# EasyEDA Pro project 云台拓展板.eprj

# Schematic Schematic1
Assembly Variant: Basic; Board Name: Board1; Create Date: 2026-10-13; Page Name: P1; Project Name: yuntai; Schematic Name: Schematic1; Update Date: 2026-10-13; Company: 嘉立创EDA; Page Size: A4; Version: V1.0
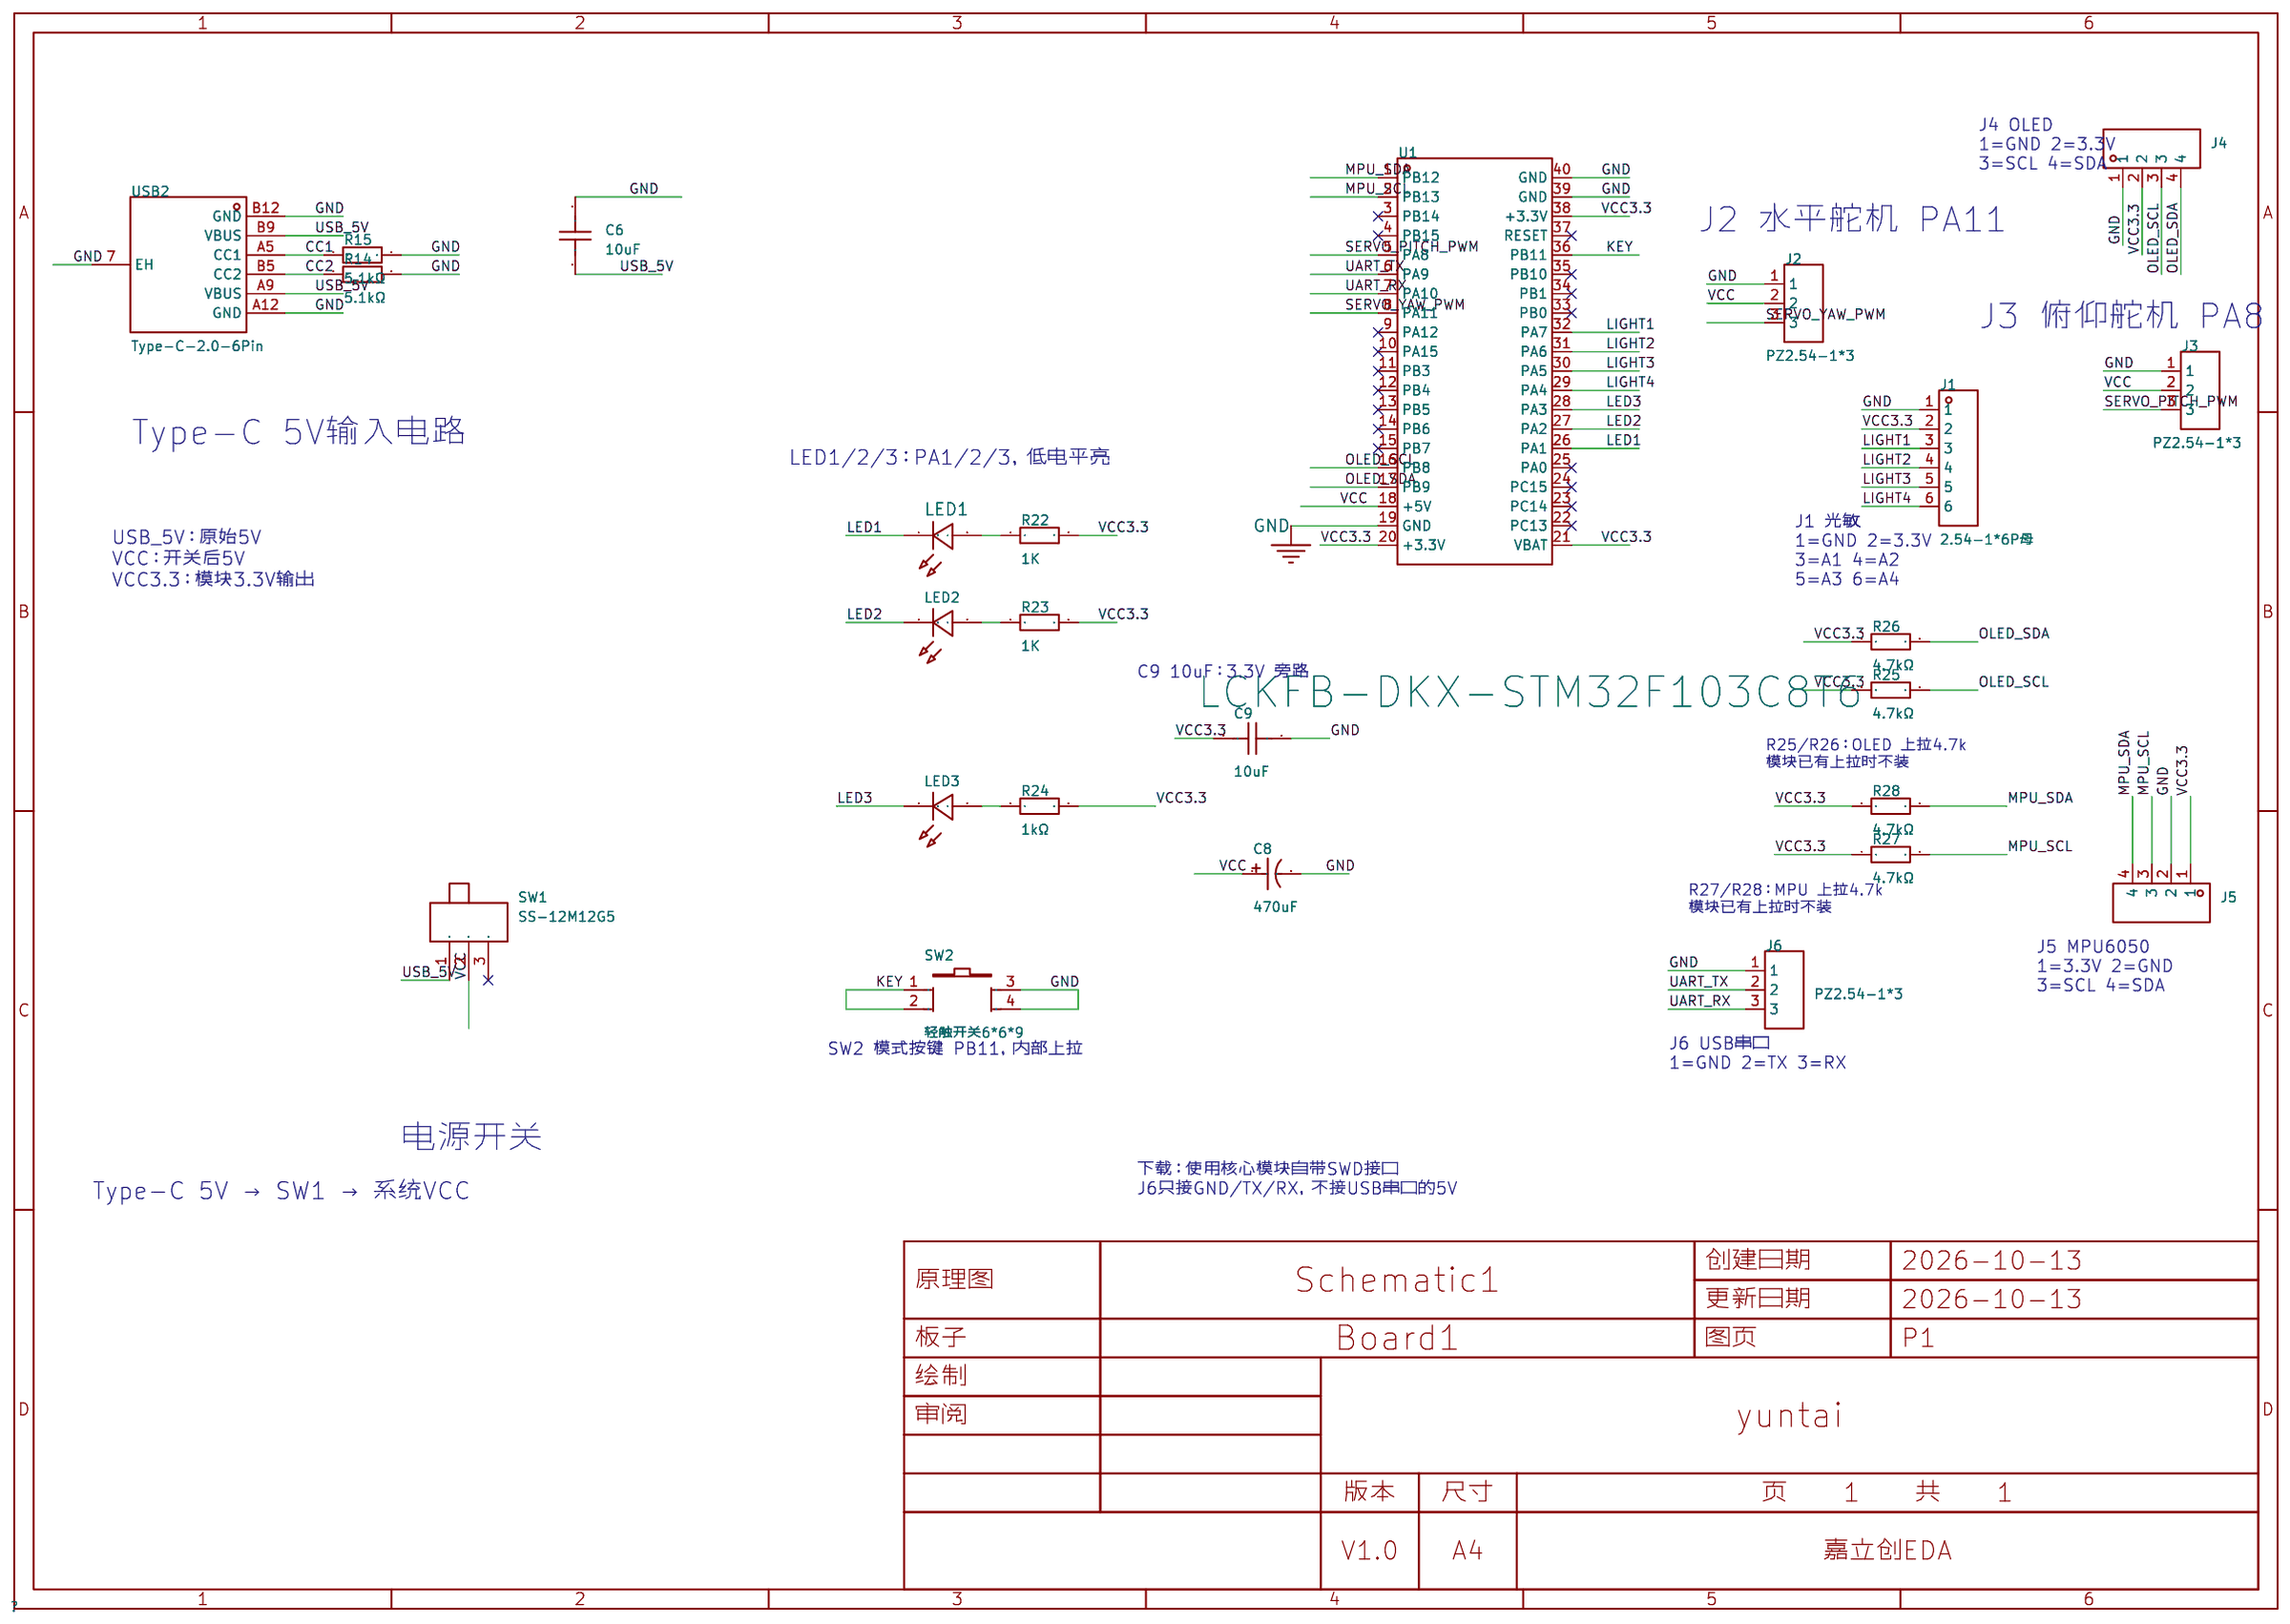
[diagram p0: schematic sheet]

## Parts
C6  10uF  [C0603]
C8  470uF  [CAP-TH_BD8.0-P3.50-D0.6-FD]
C9  10uF  [C0603]
J1  2.54-1*6P母  [HDR-TH_6P-P2.54-V-F]
J2  PZ2.54-1*3  [HDR-TH_3P-P2.54-V-M]
J3  PZ2.54-1*3  [HDR-TH_3P-P2.54-V-M]
J4  -  [HDR-TH_4P-P2.54-V-F]
J5  -  [HDR-TH_4P-P2.54-V-F]
J6  PZ2.54-1*3  [HDR-TH_3P-P2.54-V-M]
LED1  -  [LED_0805]
LED2  -  [LED_0805]
LED3  -  [LED_0805]
R14  5.1kΩ  [R0603]
R15  5.1kΩ  [R0603]
R22  1K  [R0603]
R23  1K  [R0603]
R24  1kΩ  [R0603]
R25  4.7kΩ  [R0805]
R26  4.7kΩ  [R0805]
R27  4.7kΩ  [R0805]
R28  4.7kΩ  [R0805]
SW1  SS-12M12G5  [SW-TH_SS-12M12G5]
SW2  轻触开关6*6*9  [KEY-TH_4P-L6.0-W6.0-P4.50]
U1  LCKFB-DKX-STM32F103C8T6  [CONN-TH_L53.3-W22.9_STM32F103C8T6-CARD]
USB2  Type-C-2.0-6Pin  [TYPE-C-SMD_TYPE-C-2.0-6PIN]

## Library data of the parts
C6 = CL10A106KP8NNNC: 容值:10uF;精度:±10%;额定电压:10V;材质(温度系数):X5R;; LCSC Part Name: 10uF ±10% 10V; Supplier Part: C19702; Manufacturer: SAMSUNG(三星); Supplier Footprint: 0603; JLCPCB Part Class: Basic Part; Datasheet: https://item.szlcsc.com/datasheet/CL10A106KP8NNNC/20411.html; Supplier: LCSC; Tolerance: ±10%; Voltage Rated: 10V; Temperature Coefficient: X5R; Voltage Rating: 10V
C8 = 10YXF470MEFCT78X11.5: 容值:470uF;精度:±20%;额定电压:10V;纹波电流:400mA@100kHz;等效串联电阻(ESR):-;; LCSC Part Name: 470uF ±20% 10V; Supplier Part: C88765; Manufacturer: Rubycon(红宝石); Supplier Footprint: 插件,D8xL11.5mm; JLCPCB Part Class: Extended Part; Datasheet: https://item.szlcsc.com/datasheet/10YXF470MEFCT78X11.5/89945.html; Supplier: LCSC; Tolerance: ±20%; Voltage Rating: 10V; Ripple Current: 400mA@100kHz; Pin Spacing: 3.5mm; Diameter: 8mm; Height - Seated (Max): 11.5mm; Lifetime: 6000hrs@105℃; Operating Temperature: -40℃~+105℃
C9 = CL10A106KP8NNNC: 容值:10uF;精度:±10%;额定电压:10V;温度系数:X5R;; LCSC Part Name: 10uF ±10% 10V; Supplier Part: C19702; Manufacturer: SAMSUNG(三星); Supplier Footprint: 0603; JLCPCB Part Class: Basic Part; Datasheet: https://item.szlcsc.com/datasheet/CL10A106KP8NNNC/20411.html; Supplier: LCSC; Tolerance: ±10%; Voltage Rating: 10V; Temperature Coefficient: X5R
J1 = 2.54-1*6P母: 插孔结构:1x6P;间距:2.54mm;行距:-;圆孔/方孔:方孔;安装方式:直插;排数:单排;总孔位数:6P;额定电流:3A;额定电压:-;插孔方向:顶部;塑高:8.5mm;触头材质:黄铜;触头镀层:金;工作温度:-40℃~+105℃;; LCSC Part Name: 1x6P 间距:2.54mm 直插; Supplier Part: C40877; Manufacturer: BOOMELE(博穆精密); Supplier Footprint: 插件,P=2.54mm; JLCPCB Part Class: Extended Part; Datasheet: https://item.szlcsc.com/datasheet/2.54-1*6P%25E6%25AF%258D/41861.html; Supplier: LCSC; Holes Structure: 1x6P; Pitch: 2.54mm; Circular Hole / Square Hole: 方孔; Mounting Type: 直插; Number of Rows: 单排; Number of Positions: 6P; Current Rating: 3A; Holes Direction: 顶部; Insulation Height: 8.5mm; Contact Material: 黄铜; Contact Plating: 金; Operating Temperature: -40℃~+105℃; PIN Length: 3.2mm
J2 J3 J6 = PZ2.54-1*3: 插针结构:1x3P;间距:2.54mm;圆针/方针:方针;安装方式:直插;排数:单排;总PIN位数:3P;额定电流:2.5A;配合针长度:6mm;塑高:2.54mm;端接针长度:3mm;触头材质:黄铜;触头镀层:金;工作温度:-40℃~+105℃;; LCSC Part Name: 1x3P 间距:2.54mm 方针 直插; Supplier Part: C5360899; Manufacturer: ZHOURI(洲日); Supplier Footprint: 插件,P=2.54mm; JLCPCB Part Class: Extended Part; Datasheet: https://item.szlcsc.com/datasheet/PZ2.54-1*3/6180458.html; Supplier: LCSC; Pin Structure: 1x3P; Pitch: 2.54mm; Circluar Pins/Square Pins: 方针; Mounting Type: 直插; Number of Rows: 单排; Number of Pins: 3P; Current Rating: 2.5A; Length of Mating Pin: 6mm; Insulation Height: 2.54mm; Length of End Connection Pin: 3mm; Contact Material: 黄铜; Contact Plating: 金; Operating Temperature: -40℃~+105℃
J4 J5 = HDR-F_2.54_1x4P: Supplier Part: C2718488; Supplier Footprint: 插件,P=2.54mm; Manufacturer: BOOMELE(博穆精密); Manufacturer Part: 2.54-1*4P母; Supplier: LCSC; LCSC Part Name: 1x4P 间距:2.54mm 直插; JLCPCB Part Class: Extended Part; Datasheet: https://item.szlcsc.com/datasheet/2.54-1*4P%25E6%25AF%258D/2834502.html; Holes Structure: 1x4P; Pitch: 2.54mm; Circular Hole / Square Hole: 方孔; Mounting Type: 直插; Number of Rows: 单排; Number of Positions: 4P; Current Rating: 3A; Holes Direction: 顶部; Insulation Height: 8.5mm; Contact Material: 青铜; Contact Plating: 金; Operating Temperature: -40℃~+105℃; PIN Length: 3.2mm
LED1 = LED_0805-R: Supplier Footprint: 0805
LED2 = LED_0805-B: Supplier Footprint: 0805
LED3 = LED_0805-G: Supplier Footprint: 0805
R14 R15 = RT0603BRD075K1L: 电阻类型:薄膜电阻;阻值:5.1kΩ;精度:±0.1%;功率:100mW;最大工作电压:75V;温度系数:±25ppm/℃;; LCSC Part Name: 薄膜电阻 5.1kΩ ±0.1% 100mW; Supplier Part: C122969; Manufacturer: YAGEO(国巨); Supplier Footprint: 0603; JLCPCB Part Class: Extended Part; Datasheet: https://atta.szlcsc.com/upload/public/pdf/source/20170728/C122969_1501225761505848820.pdf; Supplier: LCSC; Type: 薄膜电阻; Tolerance: ±0.1%; Power(Watts): 100mW; Overload Voltage (Max): 75V; Temperature Coefficient: ±25ppm/℃; Operating Temperature Range: -55℃~+155℃
R22 R23 = Res_0603: Supplier Footprint: 0603
R24 = 0603WAF1001T5E: 电阻类型:厚膜电阻;阻值:1kΩ;精度:±1%;功率:100mW;工作电压:75V;温度系数:±100ppm/℃;; LCSC Part Name: 1kΩ ±1% 100mW 厚膜电阻; Supplier Part: C21190; Manufacturer: UNI-ROYAL(厚声); Supplier Footprint: 0603; JLCPCB Part Class: Basic Part; Datasheet: https://item.szlcsc.com/datasheet/0603WAF1001T5E/21904.html; Supplier: LCSC; Type: 厚膜电阻; Tolerance: ±1%; Power(Watts): 100mW; Voltage-Supply(Max): 75V; Temperature Coefficient: ±100ppm/℃; Operating Temperature: -55℃~+155℃
R25-R28 = 0805W8F4701T5E: 电阻类型:厚膜电阻;阻值:4.7kΩ;精度:±1%;功率:125mW;最大工作电压:150V;温度系数:±100ppm/℃;; LCSC Part Name: 4.7kΩ ±1% 125mW 厚膜电阻; Supplier Part: C17673; Manufacturer: UNI-ROYAL(厚声); Supplier Footprint: 0805; JLCPCB Part Class: Basic Part; Datasheet: https://atta.szlcsc.com/upload/public/pdf/source/20200306/C422600_1E6D84923E4A46A82E41ADD87F860B5C.pdf; Supplier: LCSC; Type: 厚膜电阻; Tolerance: ±1%; Power(Watts): 125mW; Overload Voltage (Max): 150V; Temperature Coefficient: ±100ppm/℃; Operating Temperature Range: -55℃~+155℃
SW1 = SS-12M12G5: 电路结构:单刀双掷;安装方式:弯插;开关颜色:黑色;额定电流:6A;额定电压:120V;工作寿命:1万次;; LCSC Part Name: 柄长5mm 弯插双档 滑动开关; Supplier Part: C2884789; Manufacturer: XKB Connection(中国星坤); Supplier Footprint: 弯插,13.2x7.2mm; JLCPCB Part Class: Extended Part; Datasheet: https://item.szlcsc.com/datasheet/SS-12M12G5/3095281.html; Supplier: LCSC; Circuit: 单刀双掷; Actuator Style: 矩形柱状; Termination Style: PC引脚; Length: 13.2mm; Width: 7.2mm; Switch Height: 6.6mm; Mounting Type: 弯插; Actuator Color: 黑色; Current Rating: 6A; Voltage Rating: 120V; Life: 1万次; Operating Temperature: -40℃~+85℃
SW2 = 轻触开关6*6*9: Supplier Part: C70910; Supplier Footprint: SMD; JLCPCB Part Class: Extended Part; Supplier: LCSC
U1 = LCKFB-DKX-STM32F103C8T6: LCSC Part Name: 立创·地阔星-STM32F103C8T6开发板; Supplier Part: C22396880; Manufacturer: 立创开发板; JLCPCB Part Class: 扩展库; Datasheet: https://atta.szlcsc.com/upload/public/pdf/source/20240801/7EEF69F7480DF7C6DA98696664D658D4.pdf; Supplier: LCSC
USB2 = Type-C-2.0-6Pin: 连接器类型:Type-C;协议标准:USB 2.0;公母:-;安装方式:卧贴;触点数量:6P;端口数量:1;额定电流 - 电源:5A;工作温度:-40℃~+85℃;; LCSC Part Name: Type-C 卧贴; Supplier Part: C2987385; Manufacturer: CIKI(皓富); Supplier Footprint: SMD; JLCPCB Part Class: Extended Part; Datasheet: https://item.szlcsc.com/datasheet/Type-C-2.0-6Pin/3440240.html; Supplier: LCSC; Connector Type: Type-C; Protocol Standard: USB 2.0; Mounting Type: 卧贴; Number of Contacts: 6P; Number of Ports: 1; Current Rating-Power: 5A; Voltage Rating: 20V; Connect-Disconnect Life: 3千次; Length: 6.8mm; Operating Temperature: -40℃~+85℃; PCB Layer: Default

## Nets
GND: C6.2 C8.2 C9.2 J1.1 J2.1 J3.1 J4.1 J5.2 J6.1 R14.2 R15.2 SW2.3 SW2.4 U1.19(GND) U1.39(GND) U1.40(GND) USB2.7(EH) USB2.A12(GND) USB2.B12(GND)
VCC: C8.1 J2.2 J3.2 SW1.2 U1.18(+5V)
VCC3.3: C9.1 J1.2 J4.2 J5.1 R22.2 R23.2 R24.2 R25.1 R26.1 R27.1 R28.1 U1.20(+3.3V) U1.21(VBAT) U1.38(+3.3V)
CC1: R15.1 USB2.A5(CC1)
CC2: R14.1 USB2.B5(CC2)
KEY: SW2.1 SW2.2 U1.36(PB11)
LED1: LED1.1(C) U1.26(PA1)
LED2: LED2.1(C) U1.27(PA2)
LED3: LED3.1(C) U1.28(PA3)
LIGHT1: J1.3 U1.32(PA7)
LIGHT2: J1.4 U1.31(PA6)
LIGHT3: J1.5 U1.30(PA5)
LIGHT4: J1.6 U1.29(PA4)
MPU_SCL: J5.3 R27.2 U1.2(PB13)
MPU_SDA: J5.4 R28.2 U1.1(PB12)
OLED_SCL: J4.3 R25.2 U1.16(PB8)
OLED_SDA: J4.4 R26.2 U1.17(PB9)
SERVO_PITCH_PWM: J3.3 U1.5(PA8)
SERVO_YAW_PWM: J2.3 U1.8(PA11)
UART_RX: J6.3 U1.7(PA10)
UART_TX: J6.2 U1.6(PA9)
USB_5V: C6.1 SW1.1 USB2.A9(VBUS) USB2.B9(VBUS)
$1N125: LED3.2(A) R24.1
$1N178: LED2.2(A) R23.1
$1N180: LED1.2(A) R22.1

Not connected (* = marked no-connect by the designer): SW1 3*; U1 3(PB14)* 4(PB15)* 9(PA12)* 10(PA15)* 11(PB3)* 12(PB4)* 13(PB5)* 14(PB6)* 15(PB7)* 22(PC13)* 23(PC14)* 24(PC15)* 25(PA0)* 33(PB0)* 34(PB1)* 35(PB10)* 37(RESET)*

## Notes on the sheet
- J4 OLED
  1=GND 2=3.3V
  3=SCL 4=SDA
- J2 水平舵机 PA11
- J3 俯仰舵机 PA8
- Type-C 5V输入电路
- LED1/2/3：PA1/2/3，低电平亮
- J1 光敏
  1=GND 2=3.3V
  3=A1 4=A2
  5=A3 6=A4
- USB_5V：原始5V
  VCC：开关后5V
  VCC3.3：模块3.3V输出
- C9 10uF：3.3V 旁路
- R25/R26：OLED 上拉4.7k
  模块已有上拉时不装
- R27/R28：MPU 上拉4.7k
  模块已有上拉时不装
- J5 MPU6050
  1=3.3V 2=GND
  3=SCL 4=SDA
- J6 USB串口
  1=GND 2=TX 3=RX
- SW2 模式按键 PB11，内部上拉
- 电源开关
- 下载：使用核心模块自带SWD接口
  J6只接GND/TX/RX，不接USB串口的5V
- Type-C 5V → SW1 → 系统VCC

# Board PCB1
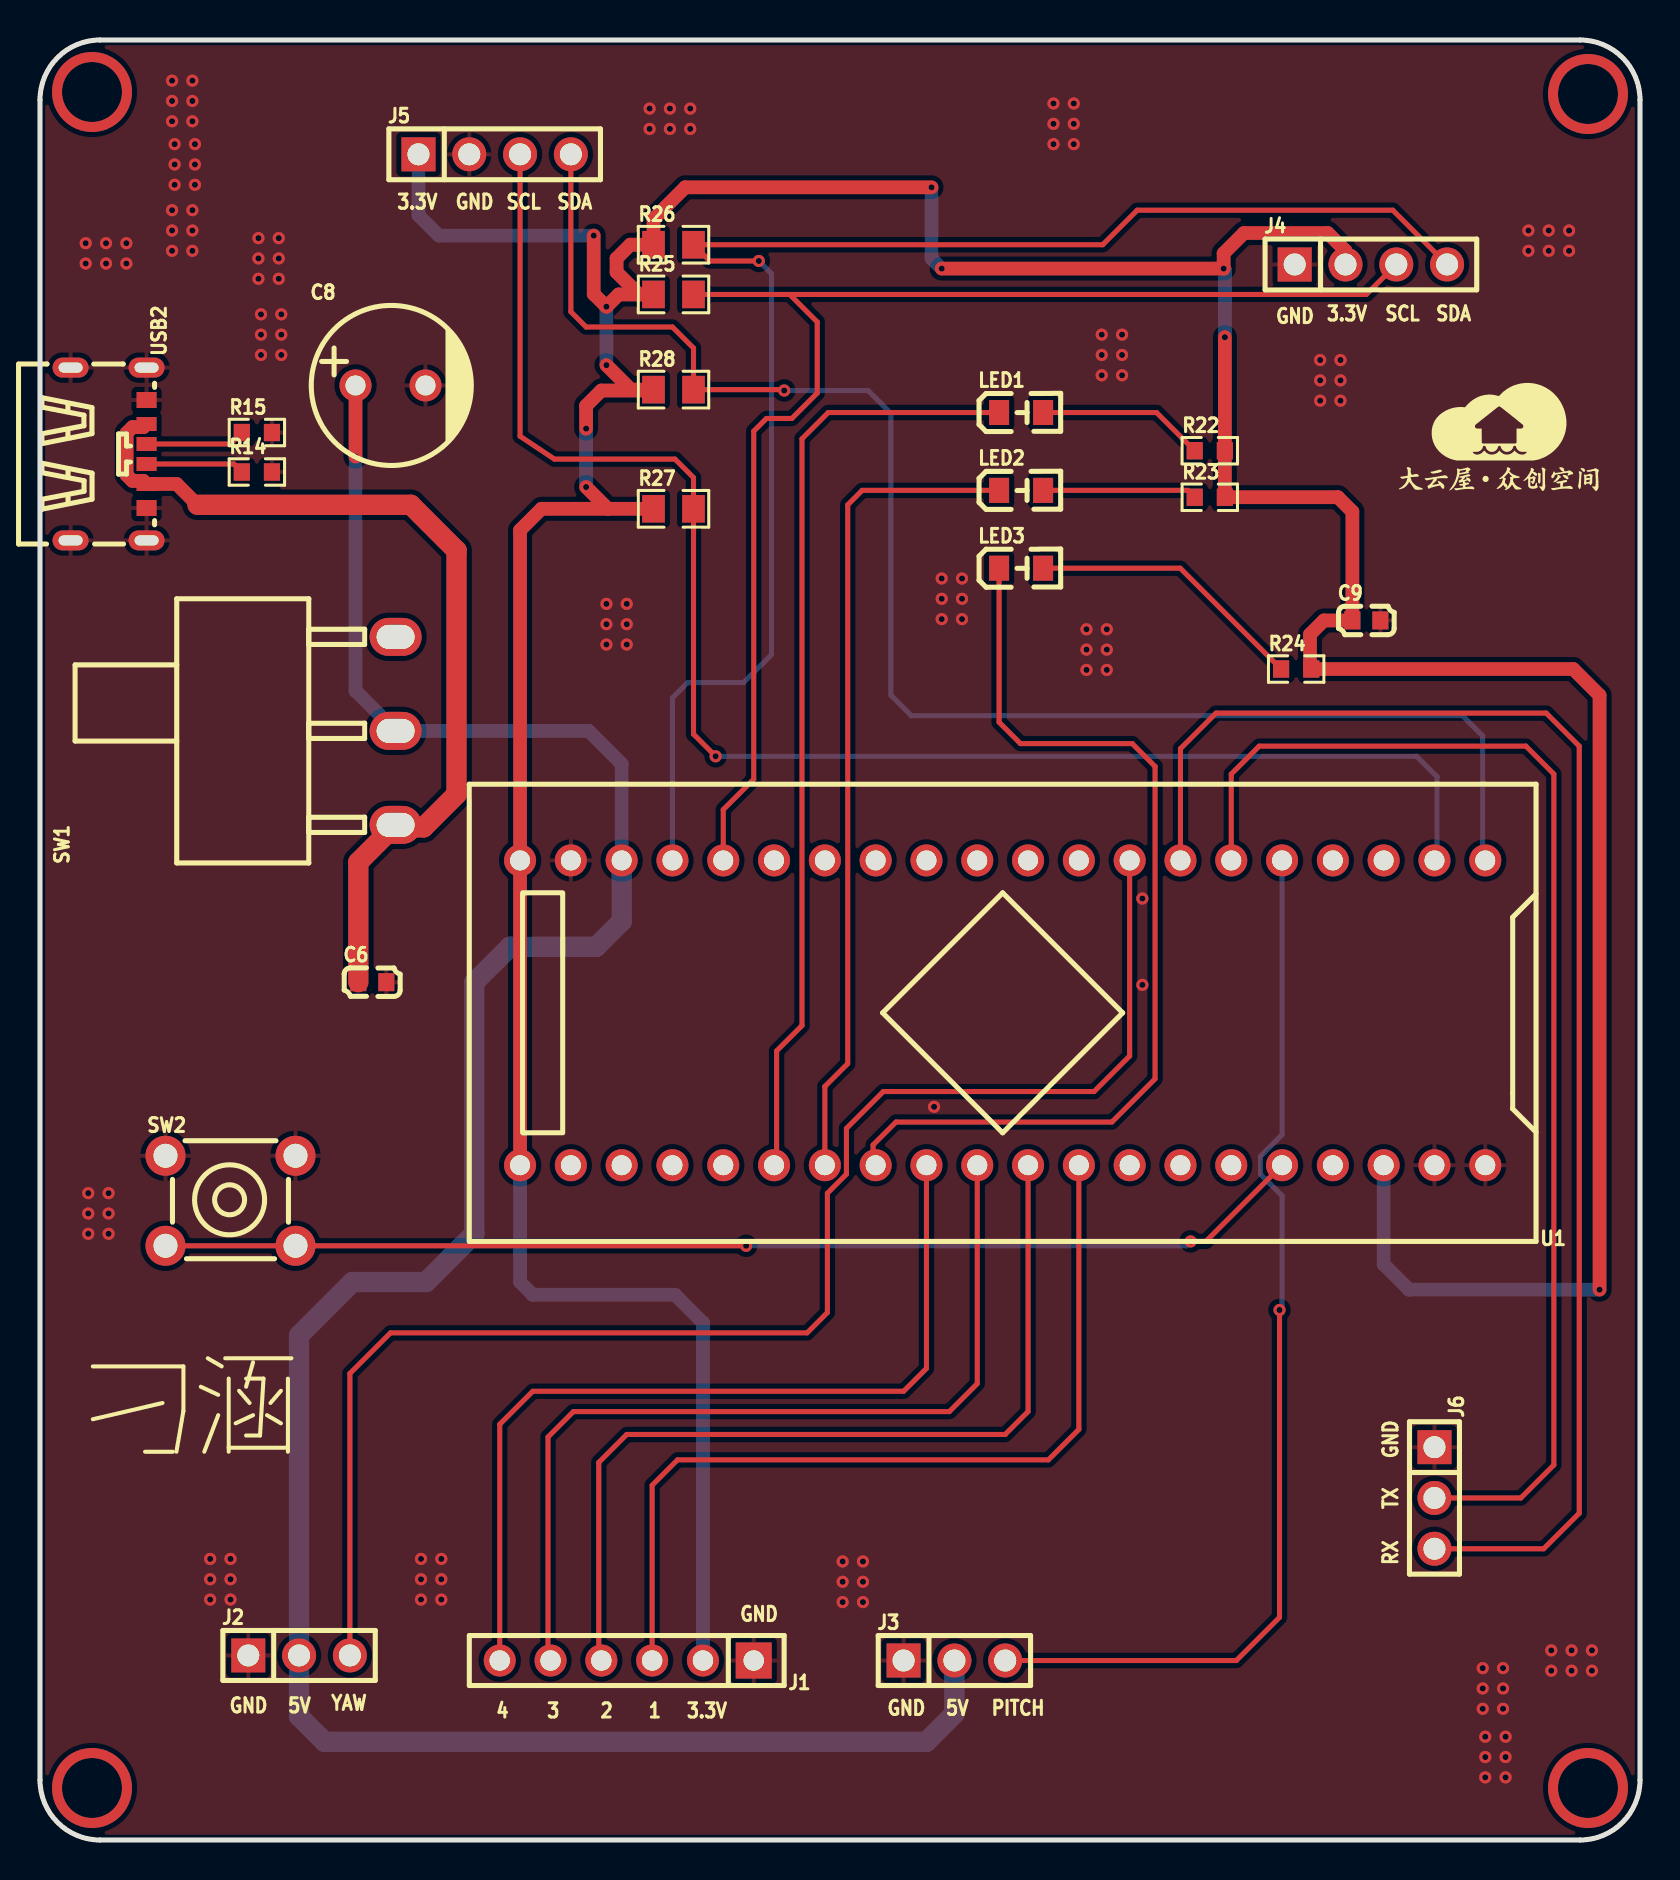
[diagram p1: board, top side]
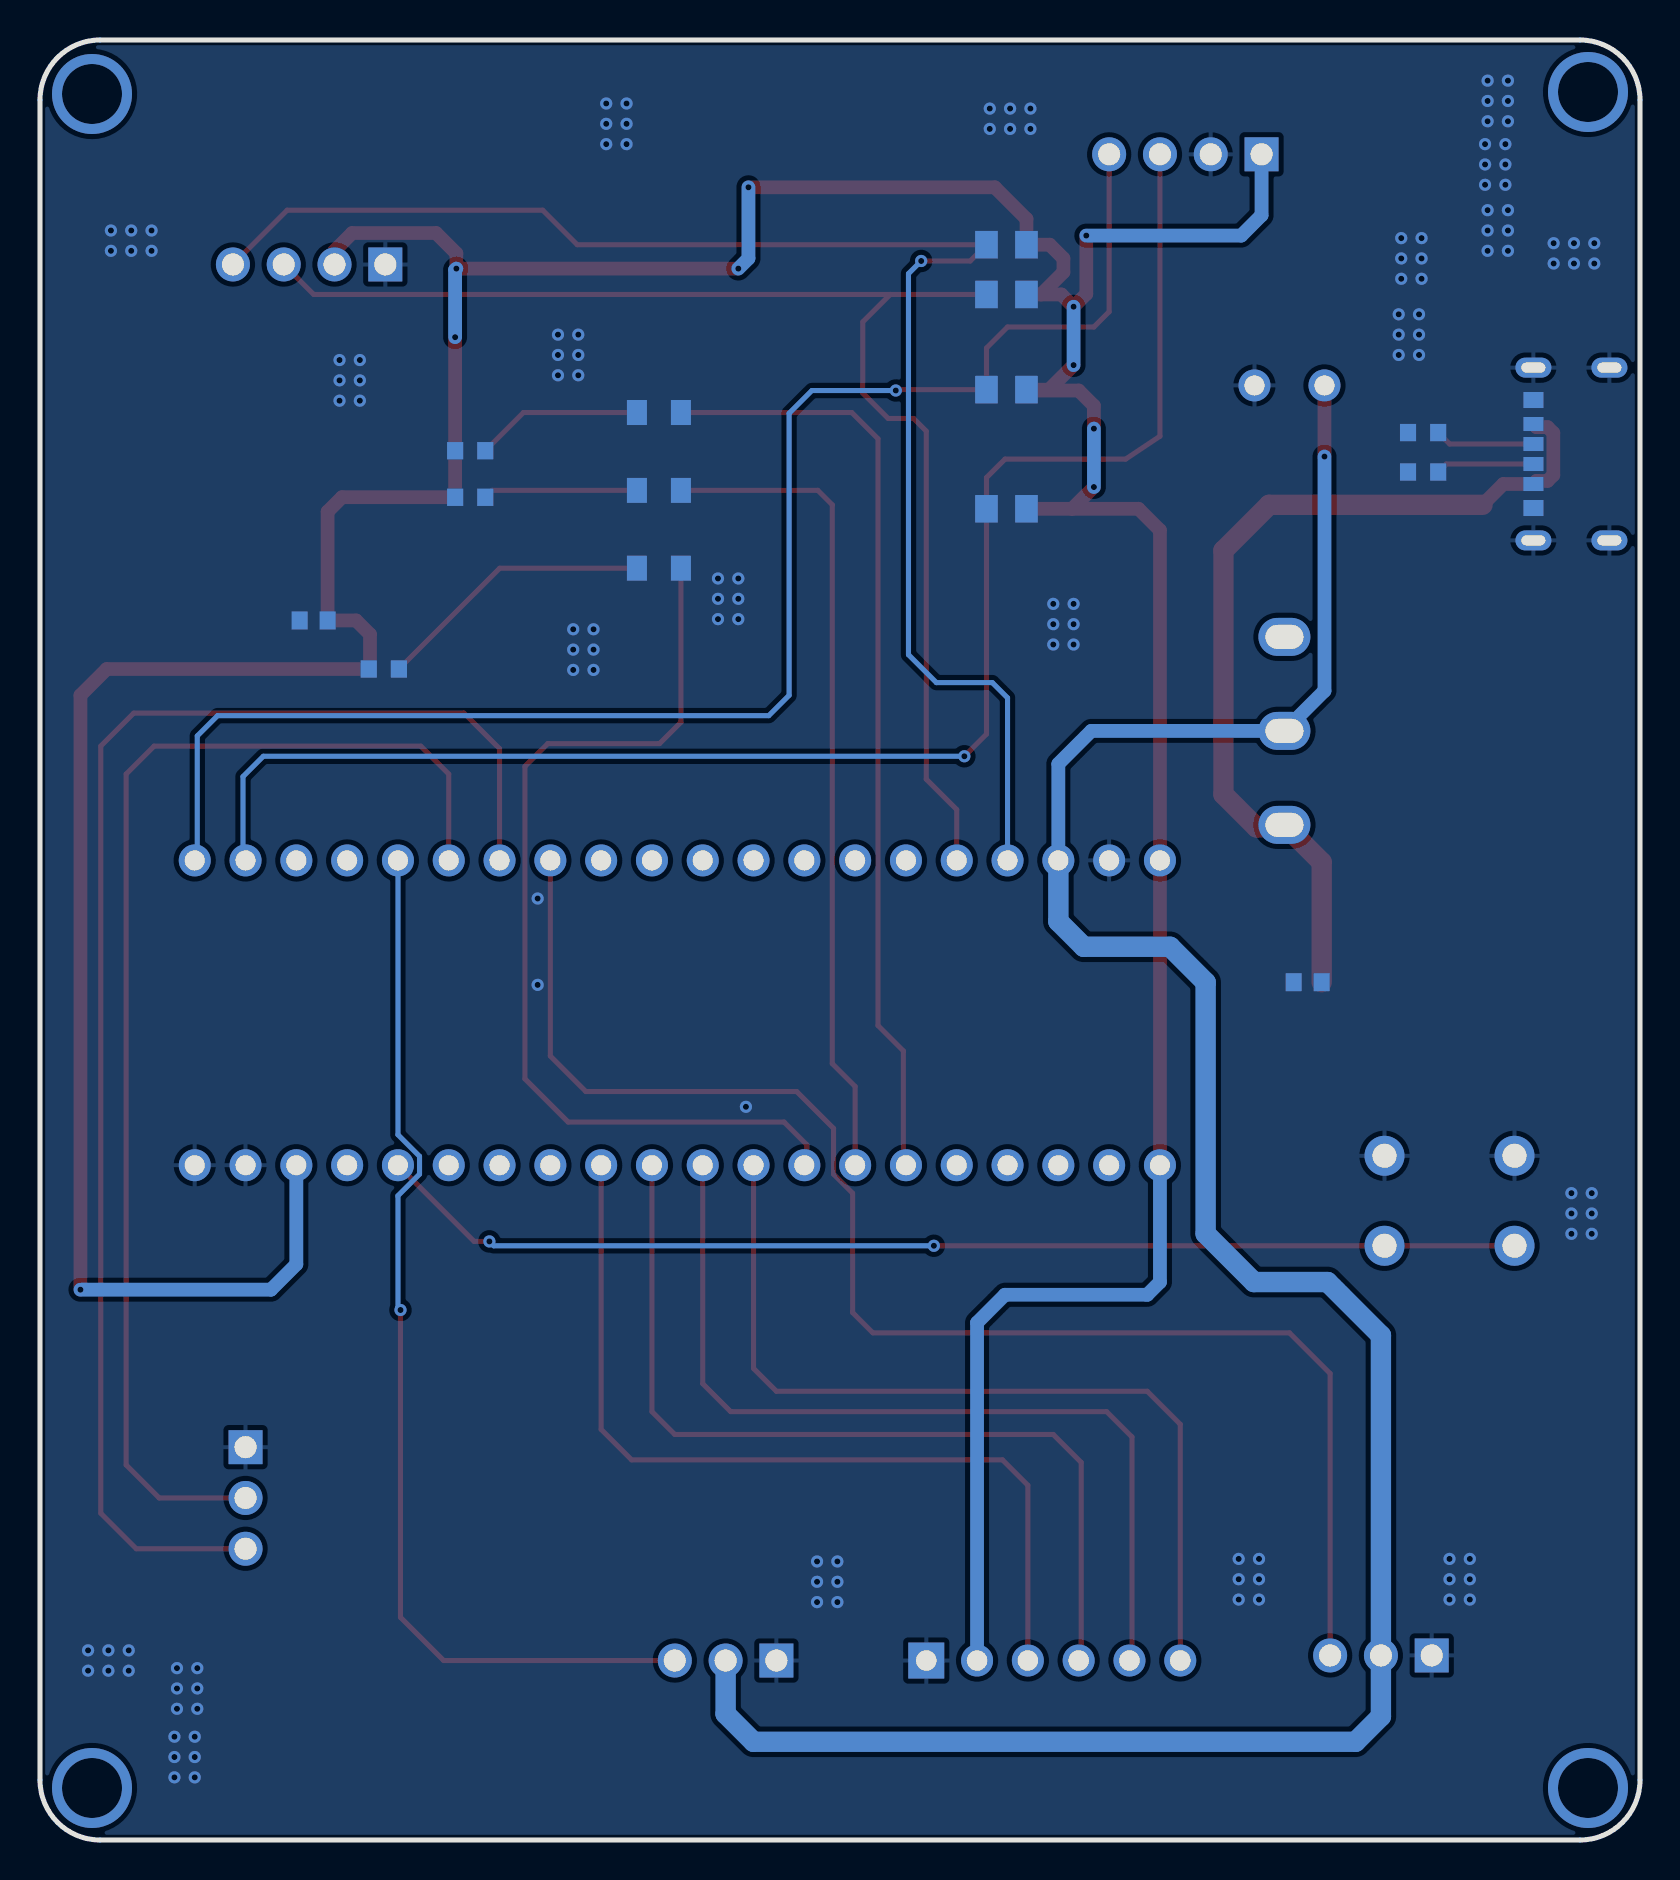
[diagram p2: board, bottom side, seen from below]

Outline 80 x 90 mm; copper layers: Top Layer, Bottom Layer. Coordinates in mm from the lower left corner of the outline.
Outline path: 0,87 0,3 arc(0.88,0.88) 3,0 77,0 arc(79.12,0.88) 80,3 80,87 arc(79.12,89.12) 77,90 3,90 arc(0.88,89.12) 0,87
Stack: Top Layer 0.035mm / Dielectric1 1.51mm FR4 er 4.5 / Bottom Layer 0.035mm

## Design rules (mm)
spacing copperThickness1oz (default): track to track 0.102, other pairs 0.152 to 0.3
spacing copperThickness2oz: track to track 0.203, other pairs 0.152 to 0.3
track width copperThickness1oz (default): min 0.127, default 0.254, max 2.54
track width copperThickness2oz: min 0.203, default 0.254, max 2.54
differential pair differentialPair (default): width min 0.127, default 0.254, max 2.54; gap min 0.152, default 0.152
net GND uses copperRegion

## Placement (name value [footprint] x y rotation side)
C6  10uF  [C0603]  16.62 42.89 0 top
C8  470uF  [CAP-TH_BD8.0-P3.50-D0.6-FD]  17.53 72.73 0 top
C9  10uF  [C0603]  66.32 60.98 0 top
J1  2.54-1*6P母  [HDR-TH_6P-P2.54-V-F]  29.34 8.97 180 top
J2  PZ2.54-1*3  [HDR-TH_3P-P2.54-V-M]  12.95 9.23 0 top
J3  PZ2.54-1*3  [HDR-TH_3P-P2.54-V-M]  45.72 8.97 0 top
J4  -  [HDR-TH_4P-P2.54-V-F]  66.54 78.78 0 top
J5  -  [HDR-TH_4P-P2.54-V-F]  22.73 84.28 0 top
J6  PZ2.54-1*3  [HDR-TH_3P-P2.54-V-M]  69.72 17.1 270 top
LED1  -  [LED_0805]  49.1 71.37 0 top
LED2  -  [LED_0805]  49.1 67.48 0 top
LED3  -  [LED_0805]  49.1 63.58 0 top
R14  5.1kΩ  [R0603]  10.84 68.4 0 top
R15  5.1kΩ  [R0603]  10.84 70.37 0 top
R22  1K  [R0603]  58.49 69.46 0 top
R23  1K  [R0603]  58.49 67.14 0 top
R24  1kΩ  [R0603]  62.81 58.55 0 top
R25  4.7kΩ  [R0805]  31.68 77.28 0 top
R26  4.7kΩ  [R0805]  31.68 79.76 0 top
R27  4.7kΩ  [R0805]  31.68 66.56 0 top
R28  4.7kΩ  [R0805]  31.68 72.52 0 top
SW1  SS-12M12G5  [SW-TH_SS-12M12G5]  17.78 55.46 90 top
SW2  轻触开关6*6*9  [KEY-TH_4P-L6.0-W6.0-P4.50]  9.53 31.96 0 top
U1  LCKFB-DKX-STM32F103C8T6  [CONN-TH_L53.3-W22.9_STM32F103C8T6-CARD]  48.13 41.36 180 top
USB2  Type-C-2.0-6Pin  [TYPE-C-SMD_TYPE-C-2.0-6PIN]  3.43 69.3 270 top

## Footprints (pads in the part's own frame, mm; a bottom-side part is the same pattern mirrored in y, then rotated)
C0603
  rect 0.8x0.9 hole 0.001: 1(-0.7,0) 2(0.7,0)
CAP-TH_BD8.0-P3.50-D0.6-FD
  round 1.6 hole 1: 1(-1.75,0) 2(1.75,0)
CONN-TH_L53.3-W22.9_STM32F103C8T6-CARD
  round 1.6 hole 1: 1(-24.13,-7.62) 2(-21.59,-7.62) 3(-19.05,-7.62) 4(-16.51,-7.62) 5(-13.97,-7.62) 6(-11.43,-7.62) 7(-8.89,-7.62) 8(-6.35,-7.62) 9(-3.81,-7.62) 10(-1.27,-7.62) 11(1.27,-7.62) 12(3.81,-7.62) 13(6.35,-7.62) 14(8.89,-7.62) 15(11.43,-7.62) 16(13.97,-7.62) 17(16.51,-7.62) 18(19.05,-7.62) 19(21.59,-7.62) 20(24.13,-7.62) 21(24.13,7.62) 22(21.59,7.62) 23(19.05,7.62) 24(16.51,7.62) 25(13.97,7.62) 26(11.43,7.62) 27(8.89,7.62) 28(6.35,7.62) 29(3.81,7.62) 30(1.27,7.62) 31(-1.27,7.62) 32(-3.81,7.62) 33(-6.35,7.62) 34(-8.89,7.62) 35(-11.43,7.62) 36(-13.97,7.62) 37(-16.51,7.62) 38(-19.05,7.62) 39(-21.59,7.62) 40(-24.13,7.62)
HDR-TH_3P-P2.54-V-M
  rect 1.7x1.7 hole 1.1: 1(-2.54,0)
  round 1.7 hole 1.1: 2(0,0) 3(2.54,0)
HDR-TH_4P-P2.54-V-F
  rect 1.7x1.7 hole 1.1: 1(-3.81,0)
  round 1.7 hole 1.1: 2(-1.27,0) 3(1.27,0) 4(3.81,0)
HDR-TH_6P-P2.54-V-F
  rect 1.8x1.8 hole 1.02: 1(-6.35,0)
  round 1.6 hole 1.02: 2(-3.81,0) 3(-1.27,0) 4(1.27,0) 5(3.81,0) 6(6.35,0)
KEY-TH_4P-L6.0-W6.0-P4.50
  round 2 hole 1.2: 1(-3.25,-2.25) 2(3.25,-2.25) 3(3.25,2.25) 4(-3.25,2.25)
LED_0805
  rect 1x1.25 hole 0.001: 1(-1.15,0.005) 2(1.05,0.005)
R0603
  rect 0.806x0.864 hole 0.001: 1(-0.753,0) 2(0.753,0)
R0805
  rect 1.133x1.377 hole 0.001: 1(-1,0) 2(1,0)
SW-TH_SS-12M12G5
  oval 1.9x2.6 hole 1.2x1.9: 1(-4.7,0) 2(0,0) 3(4.7,0)
TYPE-C-SMD_TYPE-C-2.0-6PIN
  oval 1x1.8 hole 0.5x1.2: 7(-4.32,1.9) 7(-4.32,-1.9) 7(4.32,1.9) 7(4.32,-1.9)
  rect 0.7x1 hole 0.001: A5(-0.5,1.9) A9(1.5,1.9) B5(0.5,1.9) B9(-1.5,1.9)
  rect 0.8x1 hole 0.001: A12(2.7,1.9) B12(-2.7,1.9)

## Nets
As in the schematic.

Pads without a net: SW1 3; U1 3 4 9 10 11 12 13 14 15 22 23 24 25 33 34 35 37

## Via types
v1: diameter 4, hole 3, Top Layer to Bottom Layer, 4 vias
v2: diameter 0.61, hole 0.305, Top Layer to Bottom Layer, 146 vias

## Routing (per net, layer and track width the routed paths; a pad name or vN(x,y) marks a point on that pad's centre or on a via; arc(x,y) is an arc through that point)
GND:
  vias: v2(2.29,79.84) v2(2.29,78.82) v2(2.41,32.34) v2(2.41,31.33) v2(2.41,30.31) v2(3.3,79.84) v2(3.3,78.82) v2(3.43,32.34) v2(3.43,31.33) v2(3.43,30.31) v2(4.32,79.84) v2(4.32,78.82) v2(6.6,87.97) v2(6.6,86.95) v2(6.6,85.94) v2(6.6,81.49) v2(6.6,80.47) v2(6.6,79.46) v2(6.73,84.79) v2(6.73,83.78) v2(6.73,82.76) v2(7.62,87.97) v2(7.62,86.95) v2(7.62,85.94) v2(7.62,81.49) v2(7.62,80.47) v2(7.62,79.46) v2(7.75,84.79) v2(7.75,83.78) v2(7.75,82.76) v2(8.51,14.05) v2(8.51,13.04) v2(8.51,12.02) v2(9.53,14.05) v2(9.53,13.04) v2(9.53,12.02) v2(10.92,80.09) v2(10.92,79.08) v2(10.92,78.06) v2(11.05,76.28) v2(11.05,75.27) v2(11.05,74.25) v2(11.94,80.09) v2(11.94,79.08) v2(11.94,78.06) v2(12.06,76.28) v2(12.06,75.27) v2(12.06,74.25) v2(19.05,14.05) v2(19.05,13.04) v2(19.05,12.02) v2(20.07,14.05) v2(20.07,13.04) v2(20.07,12.02) v2(28.32,61.81) v2(28.32,60.79) v2(28.32,59.77) v2(29.34,61.81) v2(29.34,60.79) v2(29.34,59.77) v2(30.48,86.57) v2(30.48,85.56) v2(31.5,86.57) v2(31.5,85.56) v2(32.51,86.57) v2(32.51,85.56) v2(40.13,13.93) v2(40.13,12.91) v2(40.13,11.9) v2(41.15,13.93) v2(41.15,12.91) v2(41.15,11.9) v2(44.7,36.66) v2(45.09,63.08) v2(45.09,62.06) v2(45.09,61.04) v2(46.1,63.08) v2(46.1,62.06) v2(46.1,61.04) v2(50.67,86.83) v2(50.67,85.81) v2(50.67,84.79) v2(51.69,86.83) v2(51.69,85.81) v2(51.69,84.79) v2(52.32,60.54) v2(52.32,59.52) v2(52.32,58.5) v2(53.09,75.27) v2(53.09,74.25) v2(53.09,73.24) v2(53.34,60.54) v2(53.34,59.52) v2(53.34,58.5) v2(54.1,75.27) v2(54.1,74.25) v2(54.1,73.24) v2(55.12,47.07) v2(55.12,42.76) v2(64.01,74) v2(64.01,72.98) v2(64.01,71.97) v2(65.02,74) v2(65.02,72.98) v2(65.02,71.97) v2(72.14,8.59) v2(72.14,7.58) v2(72.14,6.56) v2(72.26,5.16) v2(72.26,4.15) v2(72.26,3.13) v2(73.15,8.59) v2(73.15,7.58) v2(73.15,6.56) v2(73.28,5.16) v2(73.28,4.15) v2(73.28,3.13) v2(74.42,80.47) v2(74.42,79.46) v2(75.44,80.47) v2(75.44,79.46) v2(75.56,9.48) v2(75.56,8.47) v2(76.45,80.47) v2(76.45,79.46) v2(76.58,9.48) v2(76.58,8.47) v2(77.6,9.48) v2(77.6,8.47)
VCC: length 125.6
  Top Layer w0.686: C8.1 v2(15.78,69.17)
  Bottom Layer w0.686: v2(15.78,69.17) 15.78,57.46 SW1.2 27.43,55.46 29.08,53.81 U1.18
  Bottom Layer w1.016: J3.2 45.72,6.31 44.32,4.91 14.22,4.91 12.95,6.18 J2.2 12.95,25.23 15.62,27.9 19.3,27.9 21.72,30.31 21.72,42.88 23.5,44.66 27.81,44.66 29.08,45.93 U1.18
VCC3.3: length 241
  Top Layer w0.686: v2(27.31,70.57) 27.31,71.71 28.07,72.47 30.63,72.47 R28.1 29.55,72.52 v2(28.32,73.74) ; 28.39,66.56 v2(27.31,67.65) ; 28.39,66.56 25.07,66.56 24,65.49 U1.20 24,33.74 ; 28.39,66.56 R27.1 ; v2(27.69,80.22) 27.69,77.3 v2(28.32,76.67) 28.93,77.28 29.94,77.28 ; 29.94,77.28 28.83,78.39 28.83,79.08 29.52,79.76 R26.1 30.68,81.05 32.26,82.63 v2(44.58,82.63) ; 29.94,77.28 R25.1 ; v2(59.24,75.14) R22.2 R23.2 59.25,67.14 64.9,67.14 65.62,66.42 C9.1 64.2,60.98 63.5,60.28 63.5,58.61 R24.2 76.66,58.55 77.98,57.23 v2(77.98,27.52) ; J4.2 65.27,79.46 64.39,80.35 60.2,80.35 59.18,79.33 v2(59.18,78.57) v2(45.09,78.57)
  Bottom Layer w0.686: v2(77.98,27.52) 68.45,27.52 67.18,28.79 67.18,33.74 ; 24,33.74 24,27.9 24.64,27.26 31.75,27.26 33.15,25.86 J1.2 ; v2(45.09,78.57) 44.58,79.08 v2(44.58,82.63) ; J5.1 18.92,81.24 19.94,80.22 v2(27.69,80.22) ; v2(28.32,73.74) v2(28.32,76.67) ; v2(59.18,78.57) 59.24,78.51 v2(59.24,75.14) ; v2(27.31,67.65) v2(27.31,70.57)
(no net):
  vias: v1(2.6,87.4) v1(2.6,2.6) v1(77.4,87.3) v1(77.4,2.6)
CC1: length 5
  Top Layer w0.254: 5.33,69.8 9.52,69.8 10.09,70.37
CC2: length 4.9
  Top Layer w0.254: 5.33,68.8 9.69,68.8 10.09,68.4
KEY: length 57.5
  Top Layer w0.254: v2(35.31,29.71) SW2.2 SW2.1 ; v2(57.53,29.93) 58.29,29.93 62.1,33.74
  Bottom Layer w0.254: v2(57.53,29.93) 57.31,29.71 v2(35.31,29.71)
LED1: length 47.3
  Top Layer w0.254: 36.7,33.74 36.83,33.87 36.83,39.45 38.1,40.72 38.1,70.06 39.41,71.37 LED1.1
LED2: length 41.4
  Top Layer w0.254: 39.24,33.74 39.24,37.68 40.39,38.82 40.39,66.76 41.11,67.48 LED2.1
LED3: length 48.6
  Top Layer w0.254: 41.78,33.74 41.66,33.87 41.66,34.75 42.8,35.9 53.59,35.9 55.75,38.06 55.75,53.68 54.61,54.82 49.02,54.82 47.95,55.89 LED3.1
LIGHT1: length 44.5
  Top Layer w0.254: J1.3 30.61,17.74 31.88,19.01 50.42,19.01 51.94,20.53 51.94,33.74
LIGHT2: length 44.8
  Top Layer w0.254: 28.07,8.97 27.94,9.1 27.94,18.88 29.34,20.28 48.26,20.28 49.4,21.42 49.4,33.74
LIGHT3: length 44.7
  Top Layer w0.254: 46.86,33.74 46.86,22.82 45.47,21.42 26.67,21.42 25.4,20.15 25.4,9.1 J1.5
LIGHT4: length 44.5
  Top Layer w0.254: 44.32,33.74 44.32,23.58 43.18,22.44 24.64,22.44 22.99,20.78 J1.6
MPU_SCL: length 78.6
  Top Layer w0.254: v2(33.78,54.19) 32.68,55.29 R27.2 32.68,68.12 31.75,69.05 25.72,69.05 24,70.19 J5.3
  Bottom Layer w0.254: U1.2 69.85,49.11 69.85,53.17 68.83,54.19 v2(33.78,54.19)
MPU_SDA: length 78
  Top Layer w0.254: J5.4 26.54,76.41 27.31,75.65 31.62,75.65 32.68,74.6 R28.2 37.17,72.52 v2(37.21,72.47)
  Bottom Layer w0.254: U1.1 72.14,49.11 72.14,55.2 71.12,56.22 43.56,56.22 42.54,57.23 42.54,71.33 41.4,72.47 v2(37.21,72.47)
OLED_SCL: length 67.3
  Top Layer w0.254: 37.49,77.28 66.32,77.28 J4.3 ; 37.49,77.28 R25.2 ; 37.49,77.28 38.86,75.9 38.86,72.35 37.59,71.08 36.32,71.08 35.69,70.44 35.69,53.04 34.16,51.52 U1.16
OLED_SDA: length 77
  Top Layer w0.254: J4.4 67.64,81.49 54.86,81.49 53.14,79.76 R26.2 33.49,78.95 v2(35.94,78.95)
  Bottom Layer w0.254: U1.17 31.62,57.11 32.38,57.87 35.18,57.87 36.58,59.27 36.58,78.32 v2(35.94,78.95)
SERVO_PITCH_PWM: length 53.4
  Top Layer w0.254: v2(61.98,26.5) 61.98,11.13 59.82,8.97 J3.3
  Bottom Layer w0.254: U1.5 62.1,35.27 61.02,34.19 61.02,33.29 62.1,32.21 62.1,26.63 v2(61.98,26.5)
SERVO_YAW_PWM: length 74.3
  Top Layer w0.254: U1.8 54.48,39.2 52.71,37.42 42.16,37.42 40.32,35.58 40.32,33.29 39.37,32.34 39.37,26.37 38.35,25.36 17.53,25.36 15.49,23.33 J2.3
UART_RX: length 73.3
  Top Layer w0.254: U1.7 57.02,54.57 58.8,56.34 75.31,56.34 76.96,54.69 76.96,16.34 75.18,14.56 J6.3
UART_TX: length 62.8
  Top Layer w0.254: U1.6 59.56,53.3 60.96,54.69 74.29,54.69 75.69,53.3 75.69,18.75 74.04,17.1 J6.2
USB_5V: length 46
  Top Layer w0.686: 5.33,70.8 5.17,70.64 4.62,70.64 4.33,70.35 4.33,68.24 4.62,67.95 5.17,67.95 5.33,67.8 6.83,67.8 7.87,66.76
  Top Layer w1.016: C6.1 15.92,48.89 SW1.1 17.91,50.63 19.18,50.63 20.83,52.28 20.83,64.47 18.54,66.76 7.87,66.76
$1N125: length 14
  Top Layer w0.254: LED3.2 57.01,63.59 62.06,58.55
$1N178: length 7.7
  Top Layer w0.254: LED2.2 57.39,67.48 R23.1
$1N180: length 8.4
  Top Layer w0.254: LED1.2 55.83,71.37 R22.1

## Copper pours and planes (outline as drawn; the poured copper is in the pictures)
GND on Top Layer: -3.94,94.19 83.19,94.19 83.19,-2.33 -3.94,-2.33
GND on Bottom Layer: -4.44,94.7 84.46,94.7 84.46,-2.46 -4.44,-2.46

## Text on the board
Top Silkscreen Layer: GND | 5V | YAW | 3.3V | 4 | SCL | 3 | SDA | 2 | 1 | PITCH | TX | RX | 刁涵
